# Altium schematic sheet Top Sheet.SchDoc
size A4; SheetNumber: 1; SheetTotal: 5
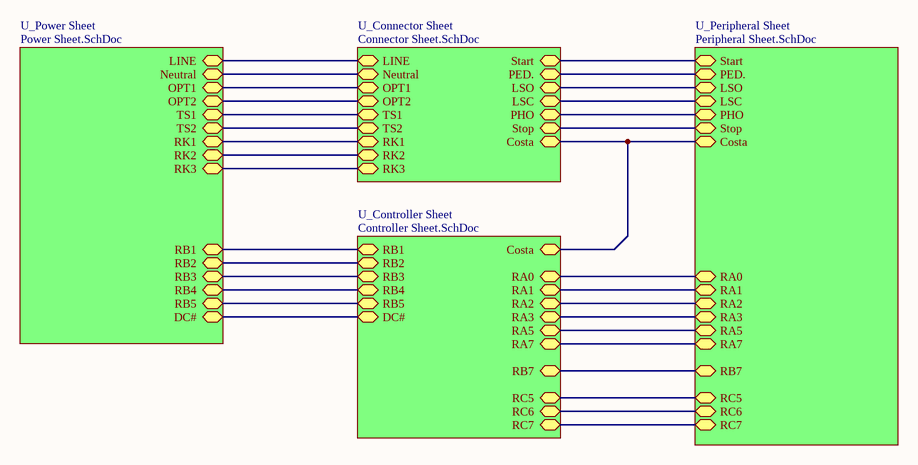
[diagram p0: Top Sheet.SchDoc]

## Sub-sheets
U_Connector Sheet = Connector Sheet.SchDoc: Neutral (bidir), LINE (bidir), OPT1 (bidir), OPT2 (bidir), TS1 (bidir), RK1 (bidir), RK3 (bidir), TS2 (bidir), RK2 (bidir), Start (bidir), PED. (bidir), LSO (bidir), LSC (bidir), PHO (bidir), Costa (bidir), Stop (bidir)
U_Controller Sheet = Controller Sheet.SchDoc: RC7 (bidir), RA5 (bidir), RA2 (bidir), RB3 (bidir), RB5 (bidir), RB7 (bidir), RA3 (bidir), RA7 (bidir), RA1 (bidir), RA0 (bidir), RB2 (bidir), RB1 (bidir), RB4 (bidir), Costa (bidir), RC5 (bidir), RC6 (bidir), DC# (bidir)
U_Peripheral Sheet = Peripheral Sheet.SchDoc: RA5 (bidir), RA2 (bidir), RB7 (bidir), RC7 (bidir), RA3 (bidir), RA7 (bidir), RA1 (bidir), RA0 (bidir), Stop (bidir), LSC (bidir), RC5 (bidir), Start (bidir), PED. (bidir), LSO (bidir), PHO (bidir), RC6 (bidir), Costa (bidir)
U_Power Sheet = Power Sheet.SchDoc: RB3 (bidir), RB5 (bidir), TS1 (bidir), RB2 (bidir), RB1 (bidir), RB4 (bidir), LINE (bidir), RK1 (bidir), OPT1 (bidir), OPT2 (bidir), RK3 (bidir), TS2 (bidir), RK2 (bidir), Neutral (bidir), DC# (bidir)

## Nets
(unnamed): sheet U_Power Sheet/RB3, sheet U_Controller Sheet/RB3
(unnamed): sheet U_Power Sheet/RB5, sheet U_Controller Sheet/RB5
(unnamed): sheet U_Power Sheet/TS1, sheet U_Connector Sheet/TS1
(unnamed): sheet U_Power Sheet/RB2, sheet U_Controller Sheet/RB2
(unnamed): sheet U_Power Sheet/RB1, sheet U_Controller Sheet/RB1
(unnamed): sheet U_Power Sheet/RB4, sheet U_Controller Sheet/RB4
(unnamed): sheet U_Power Sheet/LINE, sheet U_Connector Sheet/LINE
(unnamed): sheet U_Power Sheet/RK1, sheet U_Connector Sheet/RK1
(unnamed): sheet U_Power Sheet/OPT1, sheet U_Connector Sheet/OPT1
(unnamed): sheet U_Power Sheet/OPT2, sheet U_Connector Sheet/OPT2
(unnamed): sheet U_Power Sheet/RK3, sheet U_Connector Sheet/RK3
(unnamed): sheet U_Power Sheet/TS2, sheet U_Connector Sheet/TS2
(unnamed): sheet U_Power Sheet/RK2, sheet U_Connector Sheet/RK2
(unnamed): sheet U_Power Sheet/Neutral, sheet U_Connector Sheet/Neutral
(unnamed): sheet U_Power Sheet/DC#, sheet U_Controller Sheet/DC#
(unnamed): sheet U_Controller Sheet/RC7, sheet U_Peripheral Sheet/RC7
(unnamed): sheet U_Controller Sheet/RA5, sheet U_Peripheral Sheet/RA5
(unnamed): sheet U_Controller Sheet/RA2, sheet U_Peripheral Sheet/RA2
(unnamed): sheet U_Controller Sheet/RB7, sheet U_Peripheral Sheet/RB7
(unnamed): sheet U_Controller Sheet/RA3, sheet U_Peripheral Sheet/RA3
(unnamed): sheet U_Controller Sheet/RA7, sheet U_Peripheral Sheet/RA7
(unnamed): sheet U_Controller Sheet/RA1, sheet U_Peripheral Sheet/RA1
(unnamed): sheet U_Controller Sheet/RA0, sheet U_Peripheral Sheet/RA0
(unnamed): sheet U_Controller Sheet/Costa, sheet U_Peripheral Sheet/Costa, sheet U_Connector Sheet/Costa
(unnamed): sheet U_Controller Sheet/RC5, sheet U_Peripheral Sheet/RC5
(unnamed): sheet U_Controller Sheet/RC6, sheet U_Peripheral Sheet/RC6
(unnamed): sheet U_Peripheral Sheet/Stop, sheet U_Connector Sheet/Stop
(unnamed): sheet U_Peripheral Sheet/LSC, sheet U_Connector Sheet/LSC
(unnamed): sheet U_Peripheral Sheet/Start, sheet U_Connector Sheet/Start
(unnamed): sheet U_Peripheral Sheet/PED., sheet U_Connector Sheet/PED.
(unnamed): sheet U_Peripheral Sheet/LSO, sheet U_Connector Sheet/LSO
(unnamed): sheet U_Peripheral Sheet/PHO, sheet U_Connector Sheet/PHO

## Notes on the sheet
- File:
- Title:
- Date:
- Page
- Num:
- Total:
- Drawn By: Huzaifa Ali